# Altium schematic sheet Ethernet.SchDoc
size 420 x 297 mm; Address1: Address1; Address2: Address2; Address3: Address3; Address4: Address4; DocumentNumber: *Э3; SheetNumber: 9; SheetTotal: 11; DocumentType: Схема электрическая *
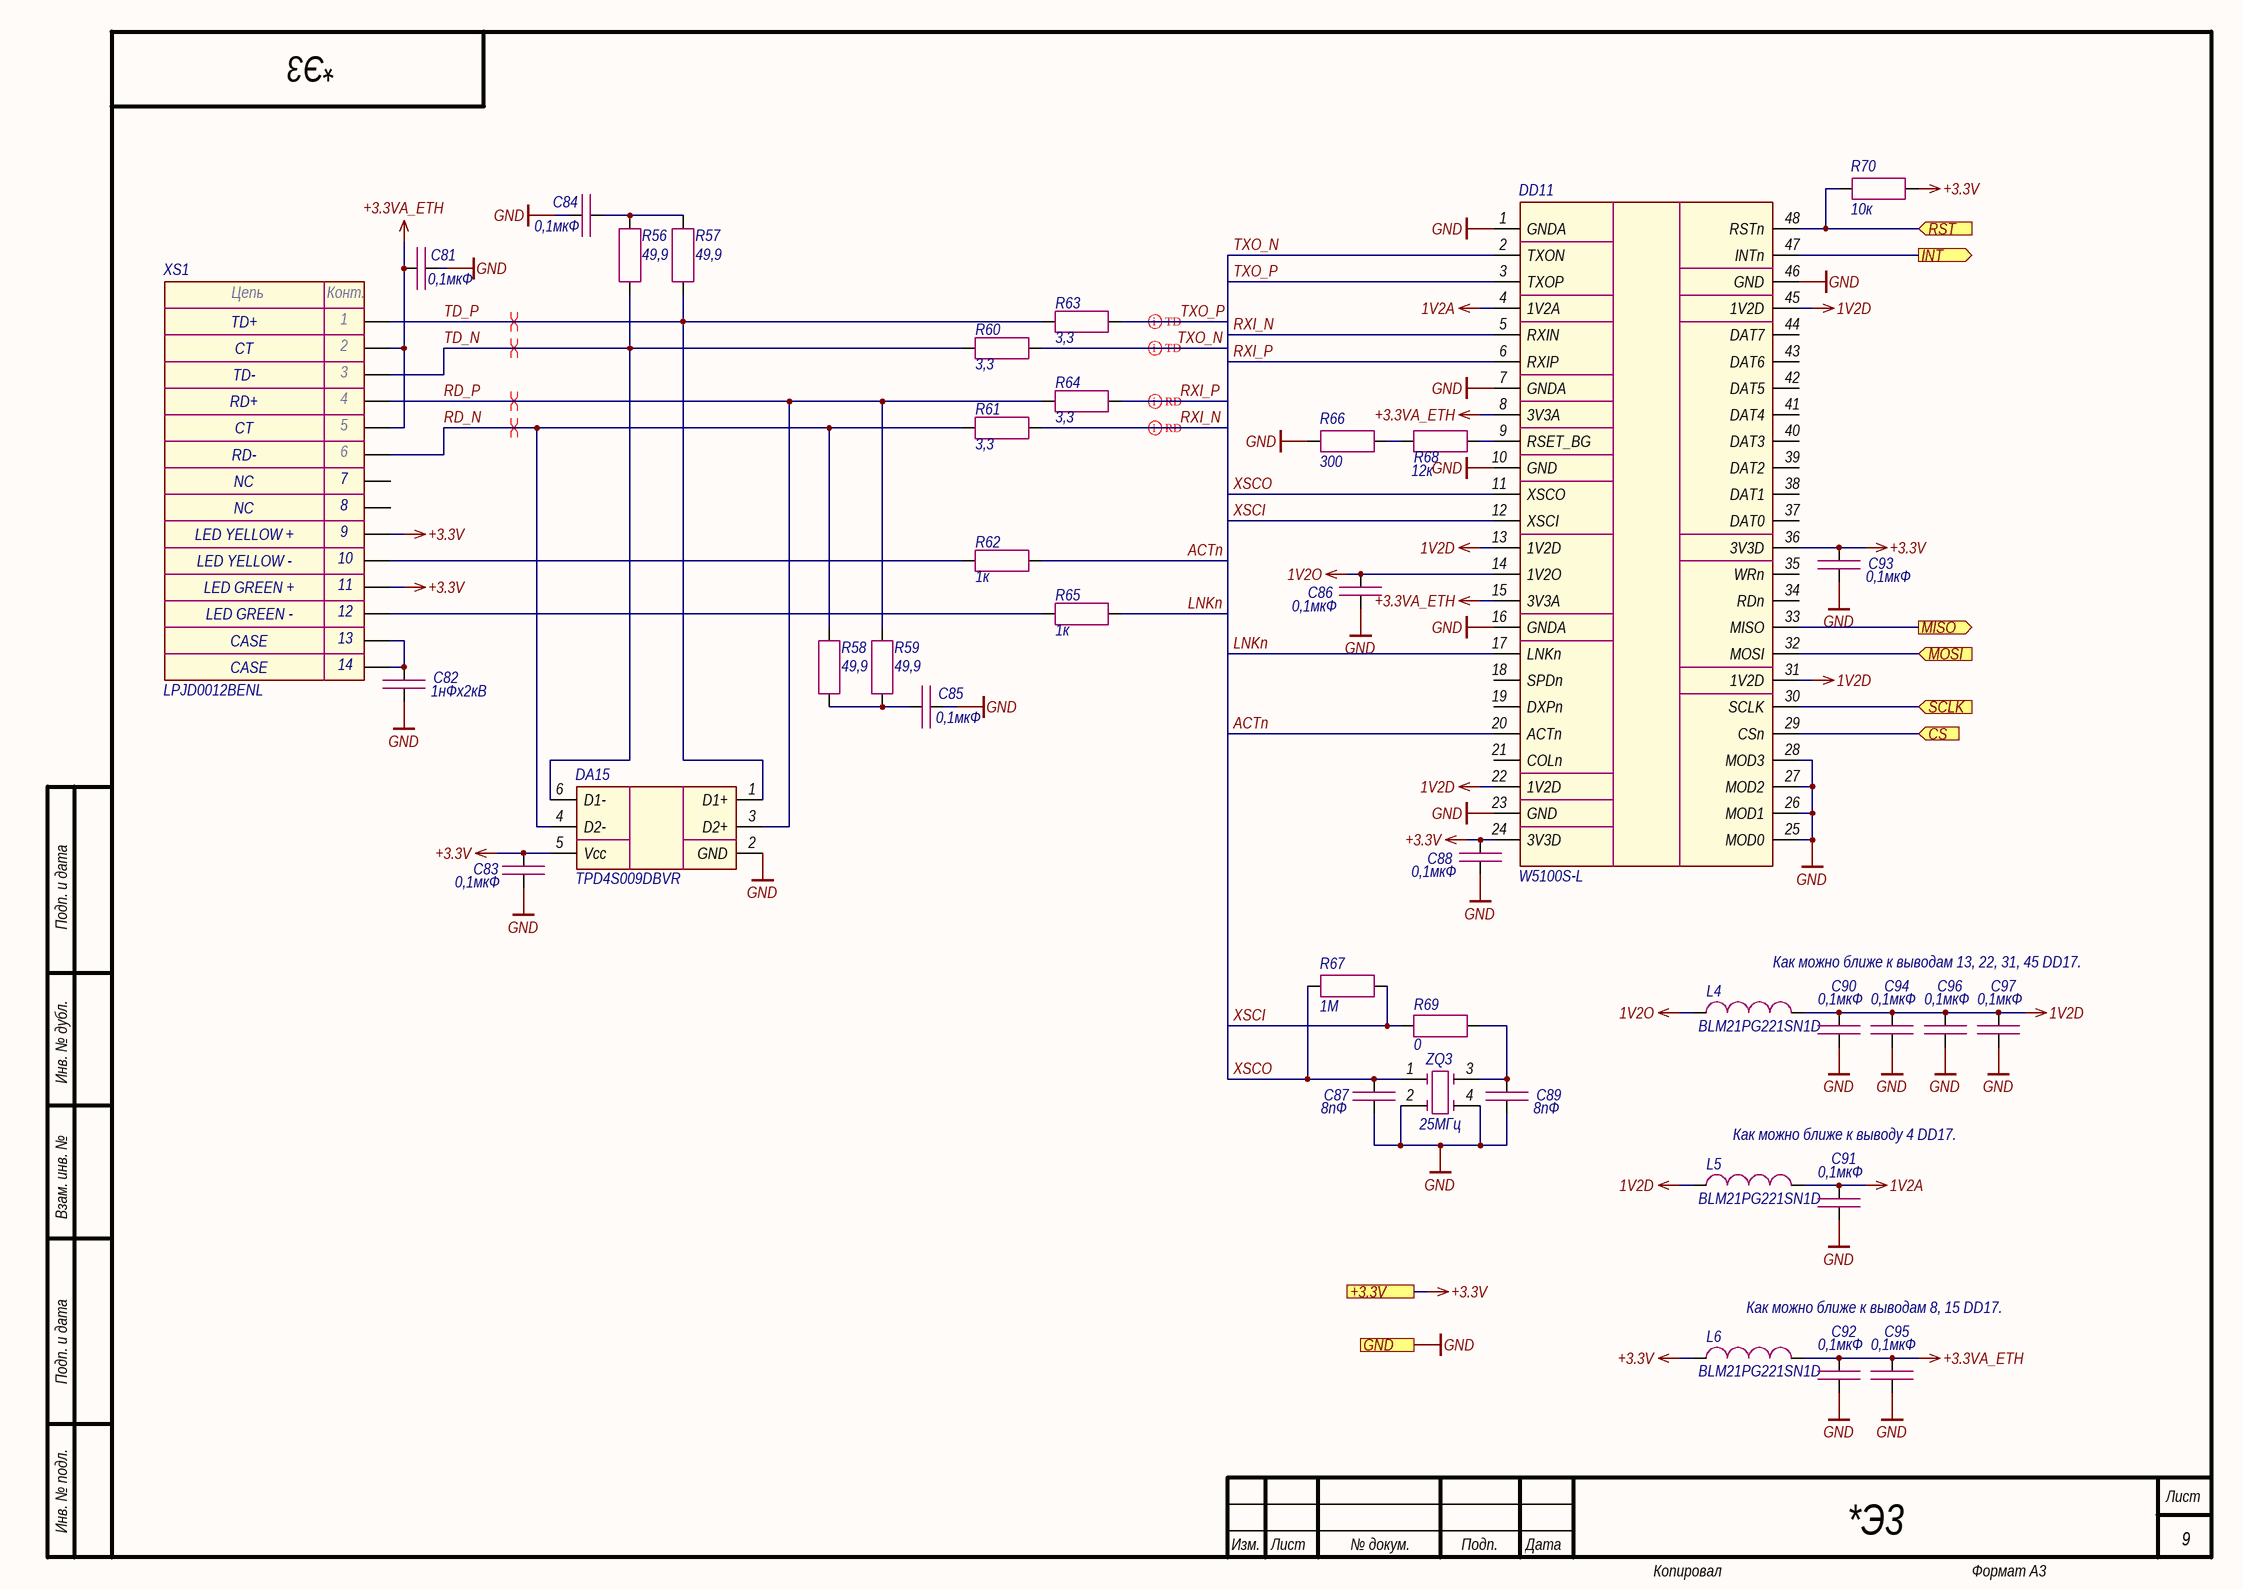
[diagram p0: Ethernet.SchDoc]

## Parts
C81  0,1мкФ  [CAP_0603]
C82  1нФх2кВ  [CAP_1206]
C83  0,1мкФ  [CAP_0603]
C84  0,1мкФ  [CAP_0603]
C85  0,1мкФ  [CAP_0603]
C86  0,1мкФ  [CAP_0603]
C87  8пФ  [CAP_0603]
C88  0,1мкФ  [CAP_0603]
C89  8пФ  [CAP_0603]
C90  0,1мкФ  [CAP_0603]
C91  0,1мкФ  [CAP_0603]
C92  0,1мкФ  [CAP_0603]
C93  0,1мкФ  [CAP_0603]
C94  0,1мкФ  [CAP_0603]
C95  0,1мкФ  [CAP_0603]
C96  0,1мкФ  [CAP_0603]
C97  0,1мкФ  [CAP_0603]
DA15  TPD4S009DBVR  [SOT-23-6]
DD11  W5100S-L  [LQFP-48]
L4  BLM21PG221SN1D  [IND_0805]
L5  BLM21PG221SN1D  [IND_0805]
L6  BLM21PG221SN1D  [IND_0805]
R56  49,9  [RES_0603]
R57  49,9  [RES_0603]
R58  49,9  [RES_0603]
R59  49,9  [RES_0603]
R60  3,3  [RES_0603]
R61  3,3  [RES_0603]
R62  1к  [RES_0603]
R63  3,3  [RES_0603]
R64  3,3  [RES_0603]
R65  1к  [RES_0603]
R66  300  [RES_0603]
R67  1М  [RES_0603]
R68  12к  [RES_0603]
R69  0  [RES_0603]
R70  10к  [RES_0603]
XS1  LPJD0012BENL  [LPJD0012BENL]
ZQ3  25МГц  [7M]

## Ports
+3.3V (see Main[2B], Fiber_interlock[2C], Flow_sensor[2C], Hardwiring[3D], LD_driver[1D], Power_supply[1D]), CS (in, see Main[2B]), GND (see Main[2B], Fiber_interlock[2C], Flow_sensor[2C], Guide_laser[1C], Hardwiring[3D], Indication[1C], LD_driver[1D], Power_supply[1D]), INT (out, see Main[2B]), MISO (out, see Main[2B]), MOSI (in, see Main[2B]), RST (in, see Main[2B]), SCLK (in, see Main[2B])

## Nets
1V2A: C91.1 DD11.4(1V2A) L5.2
1V2D: C90.1 C94.1 C96.1 C97.1 DD11.13(1V2D) DD11.22(1V2D) DD11.31(1V2D) DD11.45(1V2D) L4.2 L5.1
1V2O: C86.1 DD11.14(1V2O) L4.1
+3.3V: C83.1 C88.1 C93.1 DA15.5(Vcc) DD11.24(3V3D) DD11.36(3V3D) L6.1 R70.2 XS1.9 XS1.11 ; port +3.3V
+3.3VA_ETH: C81.1 C92.1 C95.1 DD11.8(3V3A) DD11.15(3V3A) L6.2 XS1.2 XS1.5
GND: C81.2 C82.2 C83.2 C84.2 C85.2 C86.2 C87.2 C88.2 C89.2 C90.2 C91.2 C92.2 C93.2 C94.2 C95.2 C96.2 C97.2 DA15.2(GND) DD11.1(GNDA) DD11.7(GNDA) DD11.10(GND) DD11.16(GNDA) DD11.23(GND) DD11.25(MOD0) DD11.26(MOD1) DD11.27(MOD2) DD11.28(MOD3) DD11.46(GND) R66.1 ZQ3.2 ZQ3.4 ; port GND
ACTn: DD11.20(ACTn) R62.2
CS: DD11.29(CSn) ; port CS
INT: DD11.47(INTn) ; port INT
LNKn: DD11.17(LNKn) R65.2
MISO: DD11.33(MISO) ; port MISO
MOSI: DD11.32(MOSI) ; port MOSI
RD_N: DA15.4(D2-) R58.1 R61.2 XS1.6
RD_P: DA15.3(D2+) R59.1 R64.2 XS1.4
RST: DD11.48(RSTn) R70.1 ; port RST
RXI_N: DD11.5(RXIN) R61.1
RXI_P: DD11.6(RXIP) R64.1
SCLK: DD11.30(SCLK) ; port SCLK
TD_N: DA15.6(D1-) R56.1 R60.2 XS1.3
TD_P: DA15.1(D1+) R57.1 R63.2 XS1.1
TXO_N: DD11.2(TXON) R60.1
TXO_P: DD11.3(TXOP) R63.1
XSCI: DD11.12(XSCI) R67.2 R69.1
XSCO: C87.1 DD11.11(XSCO) R67.1 ZQ3.1
NetC82_1: C82.1 XS1.13 XS1.14
NetC84_1: C84.1 R56.2 R57.2
NetC85_1: C85.1 R58.2 R59.2
NetC89_1: C89.1 R69.2 ZQ3.3
NetDD11_9: DD11.9(RSET_BG) R68.2
NetR62_1: R62.1 XS1.10
NetR65_1: R65.1 XS1.12
NetR66_2: R66.2 R68.1

Not connected (* = marked no-connect by the designer): DD11 18(SPDn) 19(DXPn) 21(COLn) 34(RDn) 35(WRn) 37(DAT0) 38(DAT1) 39(DAT2) 40(DAT3) 41(DAT4) 42(DAT5) 43(DAT6) 44(DAT7); XS1 7 8

## Layout directives
differential pair; differential pair class TD: TXO_N, TXO_P
differential pair; differential pair class RD: RXI_N, RXI_P
differential pair: RD_N, RD_P, TD_N, TD_P

## Notes on the sheet
- Как можно ближе к выводам 13, 22, 31, 45 DD17.
- Как можно ближе к выводу 4 DD17.
- Как можно ближе к выводам 8, 15 DD17.
- Подп. и дата
- Инв. № дубл.
- Взам. инв. №
- Инв. № подл.
- Изм.
- Лист
- № докум.
- Подп.
- Дата
- Копировал
- Формат А3
- (in symbol LPJD0012BENL) Цепь; Конт.; TD+; CT; TD-; RD+; RD-; NC; LED YELLOW +; LED YELLOW -; LED GREEN +; LED GREEN -; CASE

## Library data of the parts
C81 C83-C86 C88 C90-C97 = Capacitor: Manufacturer: Murata; Model: GRM188R71H104KA93D; Value: 0,1мкФ; Document: *
C82 = Capacitor: Manufacturer: Yageo; Model: CC1206KKX7RDBB102; Value: 1нФх2кВ; Document: *
C87 C89 = Capacitor: Manufacturer: Yageo; Model: CC0603CRNPO9BN8R0; Value: 8пФ; Document: *
DA15 = TPD4S009: Manufacturer: Texas Instruments; Model: TPD4S009DBVR; Document: *
DD11 = W5100S: Manufacturer: Wiznet; Model: W5100S-L; Document: *
L4-L6 = Inductor: Manufacturer: Murata; Value: *; Model: BLM21PG221SN1D; Document: *
R56-R59 = Resistor: Manufacturer: Yageo; Model: RC0603FR-0749R9L; Value: 49,9; Document: *
R60 R61 R63 R64 = Resistor: Manufacturer: Yageo; Model: RC0603FR-073R3L; Value: 3,3; Document: *
R62 R65 = Resistor: Manufacturer: Yageo; Model: RC0603FR-071KL; Value: 1к; Document: *
R66 = Resistor: Manufacturer: Yageo; Model: RC0603FR-07300RL; Value: 300; Document: *
R67 = Resistor: Manufacturer: Yageo; Model: RC0603FR-071ML; Value: 1М; Document: *
R68 = Resistor: Manufacturer: Yageo; Model: RC0603FR-0712KL; Value: 12к; Document: *
R69 = Resistor: Manufacturer: Yageo; Model: RC0603FR-070RL; Value: 0; Document: *
R70 = Resistor: Manufacturer: Yageo; Model: RC0603FR-0710KL; Value: 10к; Document: *
XS1 = LPJD0012BENL: Manufacturer: LINK-PP; Model: LPJD0012BENL; Document: *
ZQ3 = Quartz_Resonator_4-pin: Manufacturer: TXC; Model: 7M-25.000MAAJ-T; Value: 25МГц; Document: *